# Altium schematic sheet 03_PWR_PMIC_RK860-2_RK860-3.SchDoc
size 594 x 420 mm; SheetNumber: 3; SheetTotal: 3
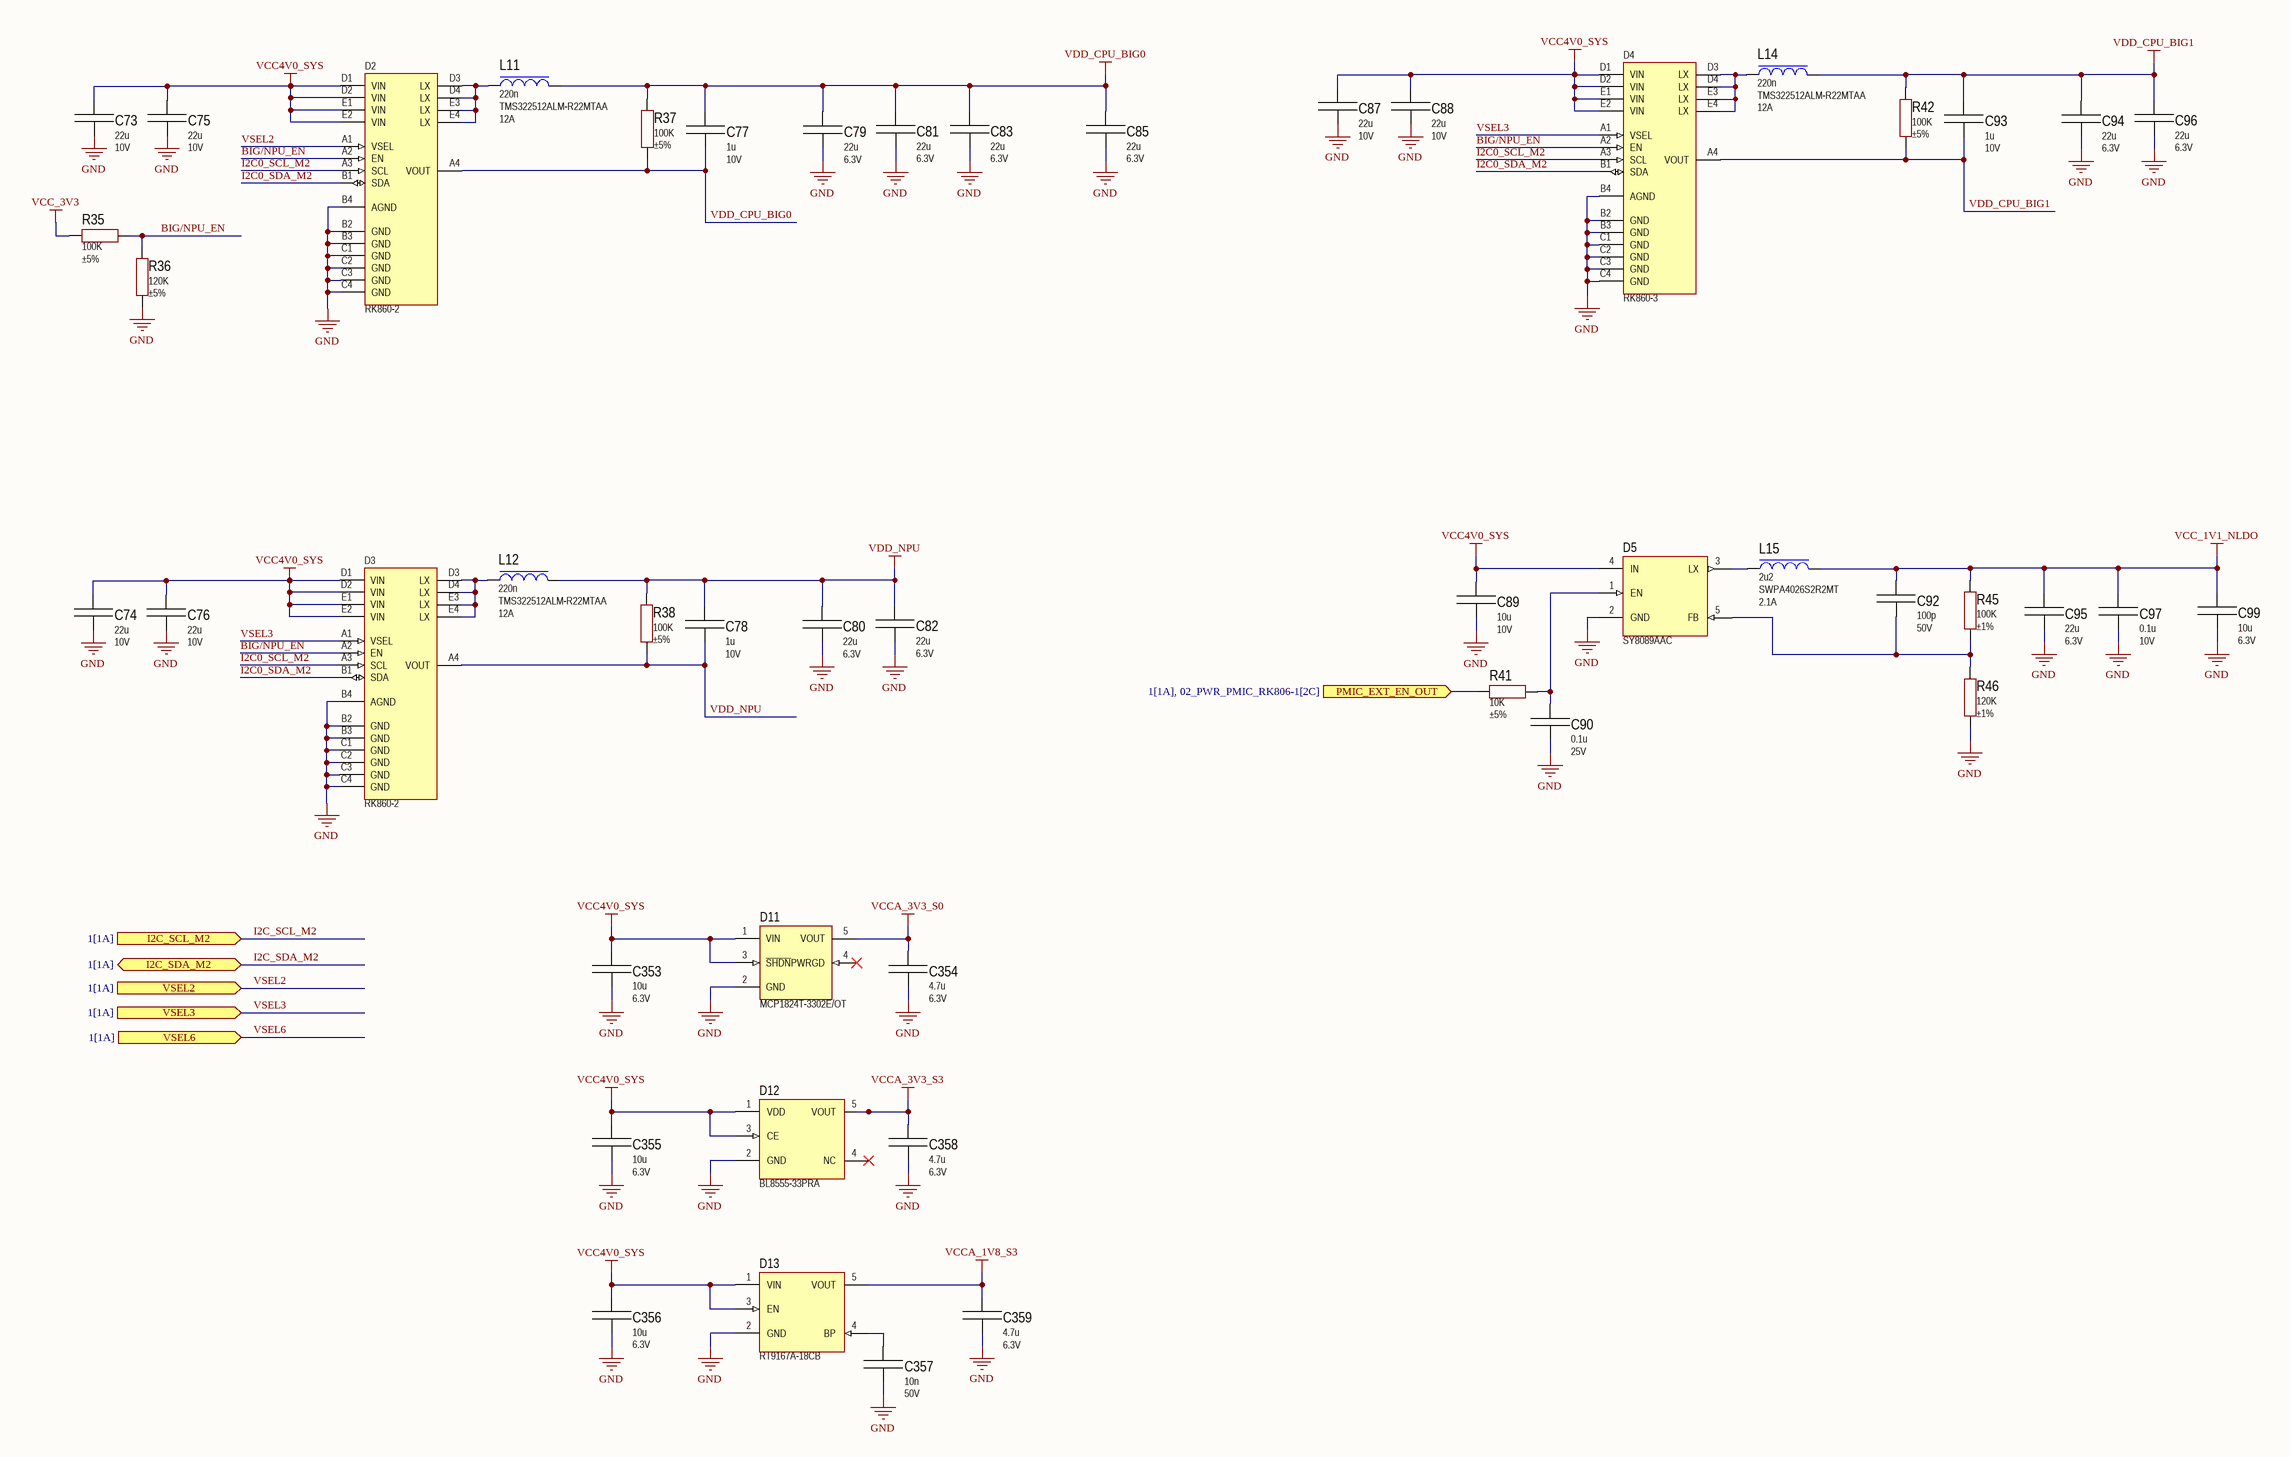
[diagram p0: 03_PWR_PMIC_RK860-2_RK860-3.SchDoc]

## Parts
C73  value 22u  Voltage: 10V  [CAPC2012X12N]  (hidden comment: C2012X5R1A226K125AB)
C74  value 22u  Voltage: 10V  [CAPC2012X12N]  (hidden comment: C2012X5R1A226K125AB)
C75  value 22u  Voltage: 10V  [CAPC2012X12N]  (hidden comment: C2012X5R1A226K125AB)
C76  value 22u  Voltage: 10V  [CAPC2012X12N]  (hidden comment: C2012X5R1A226K125AB)
C77  value 1u  Voltage: 10V  [CAPC1005X06N]  (hidden comment: C1005X5R1A105K050BB)
C78  value 1u  Voltage: 10V  [CAPC1005X06N]  (hidden comment: C1005X5R1A105K050BB)
C79  value 22u  Voltage: 6.3V  [CAPC1608X08N]  (hidden comment: C1608X5R0J226M080AC)
C80  value 22u  Voltage: 6.3V  [CAPC1608X08N]  (hidden comment: C1608X5R0J226M080AC)
C81  value 22u  Voltage: 6.3V  [CAPC1608X08N]  (hidden comment: C1608X5R0J226M080AC)
C82  value 22u  Voltage: 6.3V  [CAPC1608X08N]  (hidden comment: C1608X5R0J226M080AC)
C83  value 22u  Voltage: 6.3V  [CAPC1608X08N]  (hidden comment: C1608X5R0J226M080AC)
C85  value 22u  Voltage: 6.3V  [CAPC1608X08N]  (hidden comment: C1608X5R0J226M080AC)
C87  value 22u  Voltage: 10V  [CAPC2012X12N]  (hidden comment: C2012X5R1A226K125AB)
C88  value 22u  Voltage: 10V  [CAPC2012X12N]  (hidden comment: C2012X5R1A226K125AB)
C89  value 10u  Voltage: 10V  [CAPC1608X08N]  (hidden comment: C1608X5R1A106K080AC)
C90  value 0.1u  Voltage: 25V  [CAPC1005X06N]  (hidden comment: C1005X5R1E104K050BC)
C92  value 100p  Voltage: 50V  [CAPC1005X06N]  (hidden comment: C1005C0G1H101K050BA)
C93  value 1u  Voltage: 10V  [CAPC1005X06N]  (hidden comment: C1005X5R1A105K050BB)
C94  value 22u  Voltage: 6.3V  [CAPC1608X08N]  (hidden comment: C1608X5R0J226M080AC)
C95  value 22u  Voltage: 6.3V  [CAPC1608X08N]  (hidden comment: C1608X5R0J226M080AC)
C96  value 22u  Voltage: 6.3V  [CAPC1608X08N]  (hidden comment: C1608X5R0J226M080AC)
C97  value 0.1u  Voltage: 10V  [CAPC1005X06N]  (hidden comment: C1005X5R1A104K050BA)
C99  value 10u  Voltage: 6.3V  [CAPC1608X08N]  (hidden comment: C1608X5R0J106K080AB)
C353  value 10u  Voltage: 6.3V  [CAPC1608X08N]  (hidden comment: C1608X5R0J106K080AB)
C354  value 4.7u  Voltage: 6.3V  [CAPC1005X06N]  (hidden comment: C1005X5R0J475K050BC)
C355  value 10u  Voltage: 6.3V  [CAPC1608X08N]  (hidden comment: C1608X5R0J106K080AB)
C356  value 10u  Voltage: 6.3V  [CAPC1608X08N]  (hidden comment: C1608X5R0J106K080AB)
C357  value 10n  Voltage: 50V  [CAPC1005X06N]  (hidden comment: GRM155R71H103KA88D)
C358  value 4.7u  Voltage: 6.3V  [CAPC1005X06N]  (hidden comment: C1005X5R0J475K050BC)
C359  value 4.7u  Voltage: 6.3V  [CAPC1005X06N]  (hidden comment: C1005X5R0J475K050BC)
D2  RK860-2  [WLCSP20_RCC-L]
D3  RK860-2  [WLCSP20_RCC-L]
D4  RK860-3  [WLCSP20_RCC-L]
D5  SY8089AAC  [SOT95P280X145-5N]
D11  MCP1824T-3302E/OT  [SOT95P280X145-5N]
D12  BL8555-33PRA  [SOT95P280X145-5N]
D13  RT9167A-18CB  [SOT95P280X145-5N]
L11  value 220n  MaxCurrent: 12A  [INDC3225X12N]  (hidden comment: TMS322512ALM-R22MTAA)
L12  value 220n  MaxCurrent: 12A  [INDC3225X12N]  (hidden comment: TMS322512ALM-R22MTAA)
L14  value 220n  MaxCurrent: 12A  [INDC3225X12N]  (hidden comment: TMS322512ALM-R22MTAA)
L15  value 2u2  MaxCurrent: 2.1A  [INDP4040X26N]  (hidden comment: SWPA4026S2R2MT)
R35  value 100K  Tolerance: ±5%  [RESC1005X04N]  (hidden comment: RC0402JR-07100KL)
R36  value 120K  Tolerance: ±5%  [RESC1005X04N]  (hidden comment: RC0402JR-07120KL)
R37  value 100K  Tolerance: ±5%  [RESC1005X04N]  (hidden comment: RC0402JR-07100KL)
R38  value 100K  Tolerance: ±5%  [RESC1005X04N]  (hidden comment: RC0402JR-07100KL)
R41  value 10K  Tolerance: ±5%  [RESC1005X04N]  (hidden comment: RC0402JR-0710KL)
R42  value 100K  Tolerance: ±5%  [RESC1005X04N]  (hidden comment: RC0402JR-07100KL)
R45  value 100K  Tolerance: ±1%  [RESC1005X04N]  (hidden comment: RC0402FR-07100KL)
R46  value 120K  Tolerance: ±1%  [RESC1005X04N]  (hidden comment: RC0402FR-07120KL)

## Ports
I2C_SCL_M2 (in, see 1[1A]), I2C_SDA_M2 (bidir, see 1[1A]), PMIC_EXT_EN_OUT (in, see 1[1A], 02_PWR_PMIC_RK806-1[2C]), VSEL2 (in, see 1[1A]), VSEL3 (in, see 1[1A]), VSEL6 (in, see 1[1A])

## Nets
GND: C73.1 C74.1 C75.1 C76.1 C79.1 C80.1 C81.1 C82.1 C83.1 C85.1 C87.1 C88.1 C89.1 C90.1 C94.1 C95.1 C96.1 C97.1 C99.1 C353.1 C354.1 C355.1 C356.1 C357.1 C358.1 C359.1 D2.B2(GND) D2.B3(GND) D2.B4(AGND) D2.C1(GND) D2.C2(GND) D2.C3(GND) D2.C4(GND) D3.B2(GND) D3.B3(GND) D3.B4(AGND) D3.C1(GND) D3.C2(GND) D3.C3(GND) D3.C4(GND) D4.B2(GND) D4.B3(GND) D4.B4(AGND) D4.C1(GND) D4.C2(GND) D4.C3(GND) D4.C4(GND) D5.2(GND) D11.2(GND) D12.2(GND) D13.2(GND) R36.1 R46.1
VCC4V0_SYS: C73.2 C74.2 C75.2 C76.2 C87.2 C88.2 C89.2 C353.2 C355.2 C356.2 D2.D1(VIN) D2.D2(VIN) D2.E1(VIN) D2.E2(VIN) D3.D1(VIN) D3.D2(VIN) D3.E1(VIN) D3.E2(VIN) D4.D1(VIN) D4.D2(VIN) D4.E1(VIN) D4.E2(VIN) D5.4(IN) D11.1(VIN) D11.3(~{SHDN}) D12.1(VDD) D12.3(CE) D13.1(VIN) D13.3(EN)
VCC_1V1_NLDO: C92.2 C95.2 C97.2 C99.2 L15.2 R45.2
VCC_3V3: R35.1
VCCA_1V8_S3: C359.2 D13.5(VOUT)
VCCA_3V3_S0: C354.2 D11.5(VOUT)
VCCA_3V3_S3: C358.2 D12.5(VOUT)
VDD_CPU_BIG0: C77.1 C77.2 C79.2 C81.2 C83.2 C85.2 D2.A4(VOUT) L11.2 R37.1 R37.2
VDD_CPU_BIG1: C93.1 C93.2 C94.2 C96.2 D4.A4(VOUT) L14.2 R42.1 R42.2
VDD_NPU: C78.1 C78.2 C80.2 C82.2 D3.A4(VOUT) L12.2 R38.1 R38.2
BIG/NPU_EN: D2.A2(EN) D3.A2(EN) D4.A2(EN) R35.2 R36.2
I2C0_SCL_M2: D2.A3(SCL) D3.A3(SCL) D4.A3(SCL)
I2C0_SDA_M2: D2.B1(SDA) D3.B1(SDA) D4.B1(SDA)
I2C_SCL_M2: port I2C_SCL_M2
I2C_SDA_M2: port I2C_SDA_M2
PMIC_EXT_EN_OUT: R41.1 ; port PMIC_EXT_EN_OUT
VSEL2: D2.A1(VSEL) ; port VSEL2
VSEL3: D3.A1(VSEL) D4.A1(VSEL) ; port VSEL3
VSEL6: port VSEL6
NetC90_2: C90.2 D5.1(EN) R41.2
NetC92_1: C92.1 D5.5(FB) R45.1 R46.2
NetC357_2: C357.2 D13.4(BP)
NetD2_D3: D2.D3(LX) D2.D4(LX) D2.E3(LX) D2.E4(LX) L11.1
NetD3_D3: D3.D3(LX) D3.D4(LX) D3.E3(LX) D3.E4(LX) L12.1
NetD4_D3: D4.D3(LX) D4.D4(LX) D4.E3(LX) D4.E4(LX) L14.1
NetD5_3: D5.3(LX) L15.1

Not connected (* = marked no-connect by the designer): D11 4(PWRGD)*; D12 4(NC)*

## Notes on the sheet
- DWG NO:
- REV:
- THIS DOCUMENT AND THE DATA DISCLOSED HEREIN OR
- HEREWITH IS THE PROPERTY OF ALTIUM LIMITED AND MAY
- BE FREELY DISTRIBUTED IN WHOLE. NO RIGHTS ARE
- RESERVED OR EXPRESS OR IMPLIED WARANTEE GIVEN.
- REVISION
- DESCRIPTION
- DATE
- APPROVED
- ENG:
- APPROVALS
- PROJECT
- DSN:
- CHK:
- REFERENCE DOCUMENTS
- PROJECT REVISION:
- TITLE
- DOCUMENT REVISION:
- DESIGN ITEM:
- BOM:
- FAB DWG:
- PCB DWG:
- ASSY DWG:
- SCALE:
- A2
- SIZE
- CAGE CODE
- FILE NAME
- DWG NO.
- SHEET
- OF
- REV

## Library data of the parts
C73-C76 C87 C88 = C2012X5R1A226K125AB: Ceramic capacitor, 22uF, X5R, ±10%, 10V, 0805, -55...+85°; Manufacturer: TDK; Type: Ceramic SMD; PartNumber: C2012X5R1A226K125AB; Dielectric: X5R; Tolerance: ±10%; Temperature: -55...+85°C; Package: 0805; ComponentLink1Description: Link; ComponentLink1URL: https://product.tdk.com/system/files/dam/doc/product/capacitor/ceramic/mlcc/catalog/mlcc_commercial_general_en.pdf; ComponentLink2Description: LocalLink; ComponentLink2URL: C:\Users\Public\Documents\Altium\datasheet\Capacitors\mlcc_commercial_general_en.pdf
C77 C78 C93 = C1005X5R1A105K050BB: Ceramic capacitor, 1uF, X5R, ±10%, 10V, 0402, -55...+85°C; Manufacturer: TDK; Type: Ceramic SMD; PartNumber: C1005X5R1A105K050BB; Dielectric: X5R; Tolerance: ±10%; Temperature: -55...+85°C; Package: 0402; ComponentLink1Description: Link; ComponentLink1URL: https://product.tdk.com/en/system/files/dam/doc/product/capacitor/ceramic/mlcc/catalog/mlcc_commercial_general_en.pdf; ComponentLink2Description: LocalLink; ComponentLink2URL: C:\Users\Public\Documents\Altium\datasheet\Capacitors\mlcc_commercial_general_en.pdf
C79-C83 C85 C94-C96 = C1608X5R0J226M080AC: Ceramic capacitor, 22uF, X5R, ±20%, 6.3V, 0603, -55...+85°C; Manufacturer: TDK; Type: Ceramic SMD; PartNumber: C1608X5R0J226M080AC; Dielectric: X5R; Tolerance: ±20%; Temperature: -55...+85°C; Package: 0603; ComponentLink1Description: Link; ComponentLink1URL: https://product.tdk.com/system/files/dam/doc/product/capacitor/ceramic/mlcc/catalog/mlcc_commercial_general_en.pdf; ComponentLink2Description: LocalLink; ComponentLink2URL: C:\Users\Public\Documents\Altium\datasheet\Capacitors\mlcc_commercial_general_en.pdf
C89 = C1608X5R1A106K080AC: Ceramic capacitor, 10uF, X5R, ±10%, 10V, 0603, -55...+85°C; Manufacturer: TDK; Type: Ceramic SMD; PartNumber: C1608X5R1A106K080AC; Dielectric: X5R; Tolerance: ±10%; Temperature: -55...+85°C; Package: 0603; ComponentLink1Description: Link; ComponentLink1URL: https://product.tdk.com/system/files/dam/doc/product/capacitor/ceramic/mlcc/catalog/mlcc_commercial_general_en.pdf; ComponentLink2Description: LocalLink; ComponentLink2URL: C:\Users\Public\Documents\Altium\datasheet\Capacitors\mlcc_commercial_general_en.pdf
C90 = C1005X5R1E104K050BC: Ceramic capacitor, 0.1uF, X5R, ±10%, 25V, 0402, -55...+85°C; Manufacturer: TDK; Type: Ceramic SMD; PartNumber: C1005X5R1E104K050BC; Dielectric: X5R; Tolerance: ±10%; Temperature: -55...+85°C; Package: 0402; ComponentLink1Description: Link; ComponentLink1URL: https://product.tdk.com/en/system/files/dam/doc/product/capacitor/ceramic/mlcc/catalog/mlcc_commercial_general_en.pdf; ComponentLink2Description: LocalLink; ComponentLink2URL: C:\Users\Public\Documents\Altium\datasheet\Capacitors\mlcc_commercial_general_en.pdf
C92 = C1005C0G1H101K050BA: Ceramic capacitor, 100pF, C0G, ±10%, 50V, 0402, -55...+125°C; Manufacturer: TDK; Type: Ceramic SMD; PartNumber: C1005C0G1H101K050BA; Dielectric: C0G; Tolerance: ±10%; Temperature: -55...+125°C; Package: 0402; ComponentLink1Description: Link; ComponentLink1URL: https://product.tdk.com/en/system/files/dam/doc/product/capacitor/ceramic/mlcc/catalog/mlcc_commercial_general_en.pdf; ComponentLink2Description: LocalLink; ComponentLink2URL: C:\Users\Public\Documents\Altium\datasheet\Capacitors\mlcc_commercial_general_en.pdf
C97 = C1005X5R1A104K050BA: Ceramic capacitor, 0.1uF, X5R, ±10%, 10V, 0402, -55...+85°C; Manufacturer: TDK; Type: Ceramic SMD; PartNumber: C1005X5R1A104K050BA; Dielectric: X5R; Tolerance: ±10%; Temperature: -55...+85°C; Package: 0402; ComponentLink1Description: Link; ComponentLink1URL: https://product.tdk.com/en/system/files/dam/doc/product/capacitor/ceramic/mlcc/catalog/mlcc_commercial_general_en.pdf; ComponentLink2Description: LocalLink; ComponentLink2URL: C:\Users\Public\Documents\Altium\datasheet\Capacitors\mlcc_commercial_general_en.pdf
C99 C353 C355 C356 = C1608X5R0J106K080AB: Ceramic capacitor, 10uF, X5R, ±10%, 6.3V, 0603, -55...+85°C; Manufacturer: TDK; Type: Ceramic SMD; PartNumber: C1608X5R0J106K080AB; Dielectric: X5R; Tolerance: ±10%; Temperature: -55...+85°C; Package: 0603; ComponentLink1Description: Link; ComponentLink1URL: https://product.tdk.com/system/files/dam/doc/product/capacitor/ceramic/mlcc/catalog/mlcc_commercial_general_en.pdf; ComponentLink2Description: LocalLink; ComponentLink2URL: C:\Users\Public\Documents\Altium\datasheet\Capacitors\mlcc_commercial_general_en.pdf
C354 C358 C359 = C1005X5R0J475K050BC: Ceramic capacitor, 4,7uF, X5R, ±10%, 6.3V, 0402, -55...+85°C; Manufacturer: TDK; Type: Ceramic SMD; PartNumber: C1005X5R0J475K050BC; Dielectric: X5R; Tolerance: ±10%; Temperature: -55...+85°C; Package: 0402; ComponentLink1Description: Link; ComponentLink1URL: https://product.tdk.com/en/system/files/dam/doc/product/capacitor/ceramic/mlcc/catalog/mlcc_commercial_general_en.pdf; ComponentLink2Description: LocalLink; ComponentLink2URL: C:\Users\Public\Documents\Altium\datasheet\Capacitors\mlcc_commercial_general_en.pdf
C357 = GRM155R71H103KA88D: Ceramic capacitor, 10nF, X7R, ±10%, 50V, 0402, -55...+125°C; Manufacturer: Murata; Type: Ceramic SMD; PartNumber: GRM155R71H103KA88D; Dielectric: X7R; Tolerance: ±10%; Temperature: -55...+125°C; Package: 0402; ComponentLink1Description: Link; ComponentLink1URL: https://www.murata.com/products/productdetail?partno=GRM155R71H103KA88%23; ComponentLink2Description: LocalLink; ComponentLink2URL: C:\Users\Public\Documents\Altium\Datasheet\Capacitors\GRM155R71H103KA88#.pdf
D2 D3 = RK860-2: Synchronous step down DC/DC regulator; Manufacturer: RockChip; Type: Step-down; Package: WLCSP-20; Temperature: -40...+125°C; ComponentLink1Description: LocalLink; ComponentLink1URL: C:\Users\Public\Documents\Altium\Datasheet\ICs_PWR\RK860.pdf; PartNumber: RK860-2
D4 = RK860-3: Synchronous step down DC/DC regulator; Manufacturer: RockChip; Type: Step-down; Package: WLCSP-20; Temperature: -40...+125°C; ComponentLink1Description: LocalLink; ComponentLink1URL: C:\Users\Public\Documents\Altium\Datasheet\ICs_PWR\RK860.pdf; PartNumber: RK860-3
D5 = SY8089AAC: High Efficiency, 1MHz, 3A, 5.5V Input Synchronous Step Down Regulator; Manufacturer: Silergy; ComponentLink1Description: Link; ComponentLink2Description: LocalLink; ComponentLink2URL: C:\Users\Public\Documents\Altium\datasheet\ICs_PWR\SY8089AAC.pdf; Type: Step Down; Temperature: -40...+125°C; Package: SOT-23(6); PartNumber: SY8089AAC
D11 = MCP1824T-3302E/OT: 300 mA, Low Voltage, Low Quiescent Current LDO Regulator; Manufacturer: Microchip; ComponentLink1Description: Link; ComponentLink1URL: https://ww1.microchip.com/downloads/aemDocuments/documents/APID/ProductDocuments/DataSheets/MCP1824-Data-Sheet-DS20002070.pdf; ComponentLink2Description: LocalLink; ComponentLink2URL: C:\Users\Public\Documents\Altium\Datasheet\ICs_PWR\MCP1824-Data-Sheet-DS20002070.pdf; Type: LDO; Temperature: -40...+125°C; Package: SOT-23(5); PartNumber: MCP1824T-3302E/OT
D12 = BL8555-33PRA: Low-Noise, Fixed Output Voltage 3.3V, 500mA LDO Regulator; Manufacturer: Shanghai Belling; ComponentLink1Description: Link; ComponentLink1URL: https://jlcpcb.com/api/file/downloadByFileSystemAccessId/8588911280069074944; ComponentLink2Description: LocalLink; ComponentLink2URL: C:\Users\Public\Documents\Altium\datasheet\ICs_PWR\C313520.pdf; Type: LDO; Temperature: -40...+125°C; Package: SOT-23(5); PartNumber: BL8555-33PRA
D13 = RT9167A-18CB: Low-Noise, Fixed Output Voltage 1.8V, 500mA LDO Regulator; Manufacturer: RichTech; ComponentLink1Description: Link; ComponentLink1URL: https://www.richtek.com/assets/product_file/RT9167=RT9167A/DS9167A-29.pdf; ComponentLink2Description: LocalLink; ComponentLink2URL: C:\Users\Public\Documents\Altium\datasheet\ICs_PWR\DS9167A-29.pdf; Type: LDO; Temperature: -40...+125°C; Package: SOT-23(5); PartNumber: RT9167A-18CB
L11 L12 L14 = TMS322512ALM-R22MTAA: Power Inductor, 220nH, ±20%, 12A, SMD 3225, -40...+125°C; Manufacturer: INPAQ; DCR: 0.006R; Type: Power Inductor; Tolerance: ±20%; Temperature: -40...+125°C; Package: SMD 3225; ComponentLink1Description: Link; ComponentLink1URL: https://product.tdk.com/system/files/dam/doc/product/inductor/inductor/smd/catalog/inductor_commercial_power_tms322512alm_en.pdf; ComponentLink2Description: LocalLink; ComponentLink2URL: C:\Users\Public\Documents\Altium\Datasheet\Inductance\inductor_commercial_power_tms322512alm_en.pdf; PartNumber: TMS322512ALM-R22MTAA
L15 = SWPA4026S2R2MT: Power Inductor, 2.2uH, ±20%, 2.1A, SMD 4026, -40...+125°C; Manufacturer: Sunlord; DCR: 0.04R; Type: Power Inductor; Tolerance: ±20%; Temperature: -40...+125°C; Package: SMD 4026; ComponentLink1Description: Link; ComponentLink2Description: LocalLink; ComponentLink2URL: C:\Users\Public\Documents\Altium\Datasheet\Inductance\swpa.pdf; PartNumber: SWPA4026S2R2MT
R35 R37 R38 R42 = RC0402JR-07100KL: Resistor film, 100K, ±5%, 0402, 0.0625W, -55...+155°C; Manufacturer: Yageo; PartNumber: RC0402JR-07100KL; Type: Resistor film; Power: 0.0625W; ComponentLink1Description: Link; ComponentLink1URL: https://www.yageo.com/upload/media/product/productsearch/datasheet/rchip/PYu-RC_Group_51_RoHS_L_12.pdf; Temperature: -55...+155°C; Package: 0402; ComponentLink2Description: LocalLink; ComponentLink2URL: C:\Users\Public\Documents\Altium\Datasheet\Resistors\PYu-RC_Group_51_RoHS_L_12.pdf
R36 = RC0402JR-07120KL: Resistor film, 120K, ±5%, 0402, 0.0625W, -55...+155°C; Manufacturer: Yageo; PartNumber: RC0402JR-07120KL; Type: Resistor film; Power: 0.0625W; ComponentLink1Description: Link; ComponentLink1URL: https://www.yageo.com/upload/media/product/productsearch/datasheet/rchip/PYu-RC_Group_51_RoHS_L_12.pdf; Temperature: -55...+155°C; Package: 0402; ComponentLink2Description: LocalLink; ComponentLink2URL: C:\Users\Public\Documents\Altium\Datasheet\Resistors\PYu-RC_Group_51_RoHS_L_12.pdf
R41 = RC0402JR-0710KL: Resistor film, 10K, ±5%, 0402, 0.0625W, -55...+155°C; Manufacturer: Yageo; PartNumber: RC0402JR-0710KL; Type: Resistor film; Power: 0.0625W; ComponentLink1Description: Link; ComponentLink1URL: https://www.yageo.com/upload/media/product/productsearch/datasheet/rchip/PYu-RC_Group_51_RoHS_L_12.pdf; Temperature: -55...+155°C; Package: 0402; ComponentLink2Description: LocalLink; ComponentLink2URL: C:\Users\Public\Documents\Altium\Datasheet\Resistors\PYu-RC_Group_51_RoHS_L_12.pdf
R45 = RC0402FR-07100KL: Resistor film, 100K, ±1%, 0402, 0.0625W, -55...+155°C; Manufacturer: Yageo; PartNumber: RC0402FR-07100KL; Type: Resistor film; Power: 0.0625W; ComponentLink1Description: Link; ComponentLink1URL: https://www.yageo.com/upload/media/product/productsearch/datasheet/rchip/PYu-RC_Group_51_RoHS_L_12.pdf; Temperature: -55...+155°C; Package: 0402; ComponentLink2Description: LocalLink; ComponentLink2URL: C:\Users\Public\Documents\Altium\Datasheet\Resistors\PYu-RC_Group_51_RoHS_L_12.pdf
R46 = RC0402FR-07120KL: Resistor film, 120K, ±1%, 0402, 0.0625W, -55...+155°C; Manufacturer: Yageo; PartNumber: RC0402FR-07120KL; Type: Resistor film; Power: 0.0625W; ComponentLink1Description: Link; ComponentLink1URL: https://www.yageo.com/upload/media/product/productsearch/datasheet/rchip/PYu-RC_Group_51_RoHS_L_12.pdf; Temperature: -55...+155°C; Package: 0402; ComponentLink2Description: LocalLink; ComponentLink2URL: C:\Users\Public\Documents\Altium\Datasheet\Resistors\PYu-RC_Group_51_RoHS_L_12.pdf